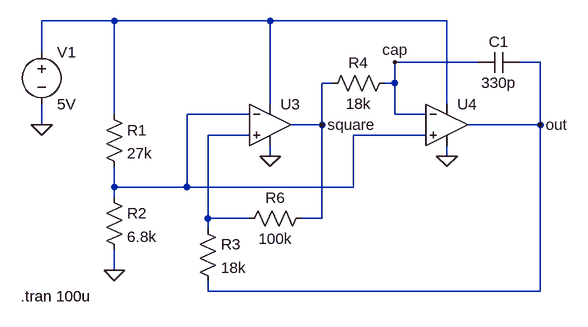
[diagram p0: schematic saw_generator.asc]
saw_generator.asc, the LTspice schematic file:
Version 4
SHEET 1 1216 680
WIRE -112 -32 -224 -32
WIRE 128 -32 -112 -32
WIRE 400 -32 128 -32
WIRE -224 16 -224 -32
WIRE 448 32 320 32
WIRE 544 32 512 32
WIRE 224 64 208 64
WIRE 320 64 320 32
WIRE 320 64 304 64
WIRE 128 96 128 -32
WIRE 400 96 400 -32
WIRE -112 112 -112 -32
WIRE 96 112 0 112
WIRE 320 112 320 64
WIRE 368 112 320 112
WIRE -224 128 -224 96
WIRE 208 128 208 64
WIRE 208 128 160 128
WIRE 544 128 544 32
WIRE 544 128 432 128
WIRE 96 144 32 144
WIRE 368 144 256 144
WIRE 128 176 128 160
WIRE 400 176 400 160
WIRE -112 224 -112 192
WIRE 0 224 0 112
WIRE 0 224 -112 224
WIRE 256 224 256 144
WIRE 256 224 0 224
WIRE -112 240 -112 224
WIRE 32 272 32 144
WIRE 96 272 32 272
WIRE 208 272 208 128
WIRE 208 272 176 272
WIRE 32 288 32 272
WIRE -112 352 -112 320
WIRE 32 384 32 368
WIRE 544 384 544 128
WIRE 544 384 32 384
FLAG -224 128 0
FLAG -112 352 0
FLAG 128 176 0
FLAG 400 176 0
FLAG 544 128 out
FLAG 320 32 cap
FLAG 208 128 square
SYMBOL res -128 96 R0
SYMATTR InstName R1
SYMATTR Value 27k
SYMBOL res -128 224 R0
SYMATTR InstName R2
SYMATTR Value 6.8k
SYMBOL voltage -224 0 R0
WINDOW 123 0 0 Left 2
WINDOW 39 0 0 Left 2
SYMATTR InstName V1
SYMATTR Value 5V
SYMBOL res 16 272 R0
SYMATTR InstName R3
SYMATTR Value 18k
SYMBOL res 208 80 R270
WINDOW 0 32 56 VTop 2
WINDOW 3 0 56 VBottom 2
SYMATTR InstName R4
SYMATTR Value 18k
SYMBOL res 80 288 R270
WINDOW 0 32 56 VTop 2
WINDOW 3 0 56 VBottom 2
SYMATTR InstName R6
SYMATTR Value 100k
SYMBOL cap 448 48 R270
WINDOW 0 32 32 VTop 2
WINDOW 3 0 32 VBottom 2
SYMATTR InstName C1
SYMATTR Value 330p
SYMBOL Opamps\\UniversalOpamp2 128 128 R0
SYMATTR InstName U3
SYMBOL Opamps\\UniversalOpamp2 400 128 R0
SYMATTR InstName U4
TEXT -256 392 Left 2 !.tran 100u

The netlist it stands for:
* saw_generator.asc
R1 N001 N002 27k
R2 N002 0 6.8k
V1 N001 0 5V
R3 N003 out 18k
R4 square cap 18k
R6 N003 square 100k
C1 cap out 330p
XU3 N003 N002 N001 0 square level.2 Avol=1Meg GBW=10Meg Slew=10Meg ilimit=25m rail=0 Vos=0 phimargin=45 en=0 enk=0 in=0 ink=0 Rin=500Meg  ; pins IN+ IN- V+ V- OUT
XU4 N002 cap N001 0 out level.2 Avol=1Meg GBW=10Meg Slew=10Meg ilimit=25m rail=0 Vos=0 phimargin=45 en=0 enk=0 in=0 ink=0 Rin=500Meg  ; pins IN+ IN- V+ V- OUT
.tran 100u
.lib UniversalOpamps2.sub
.backanno
.end